# Altium project Digit_input.PrjPcb
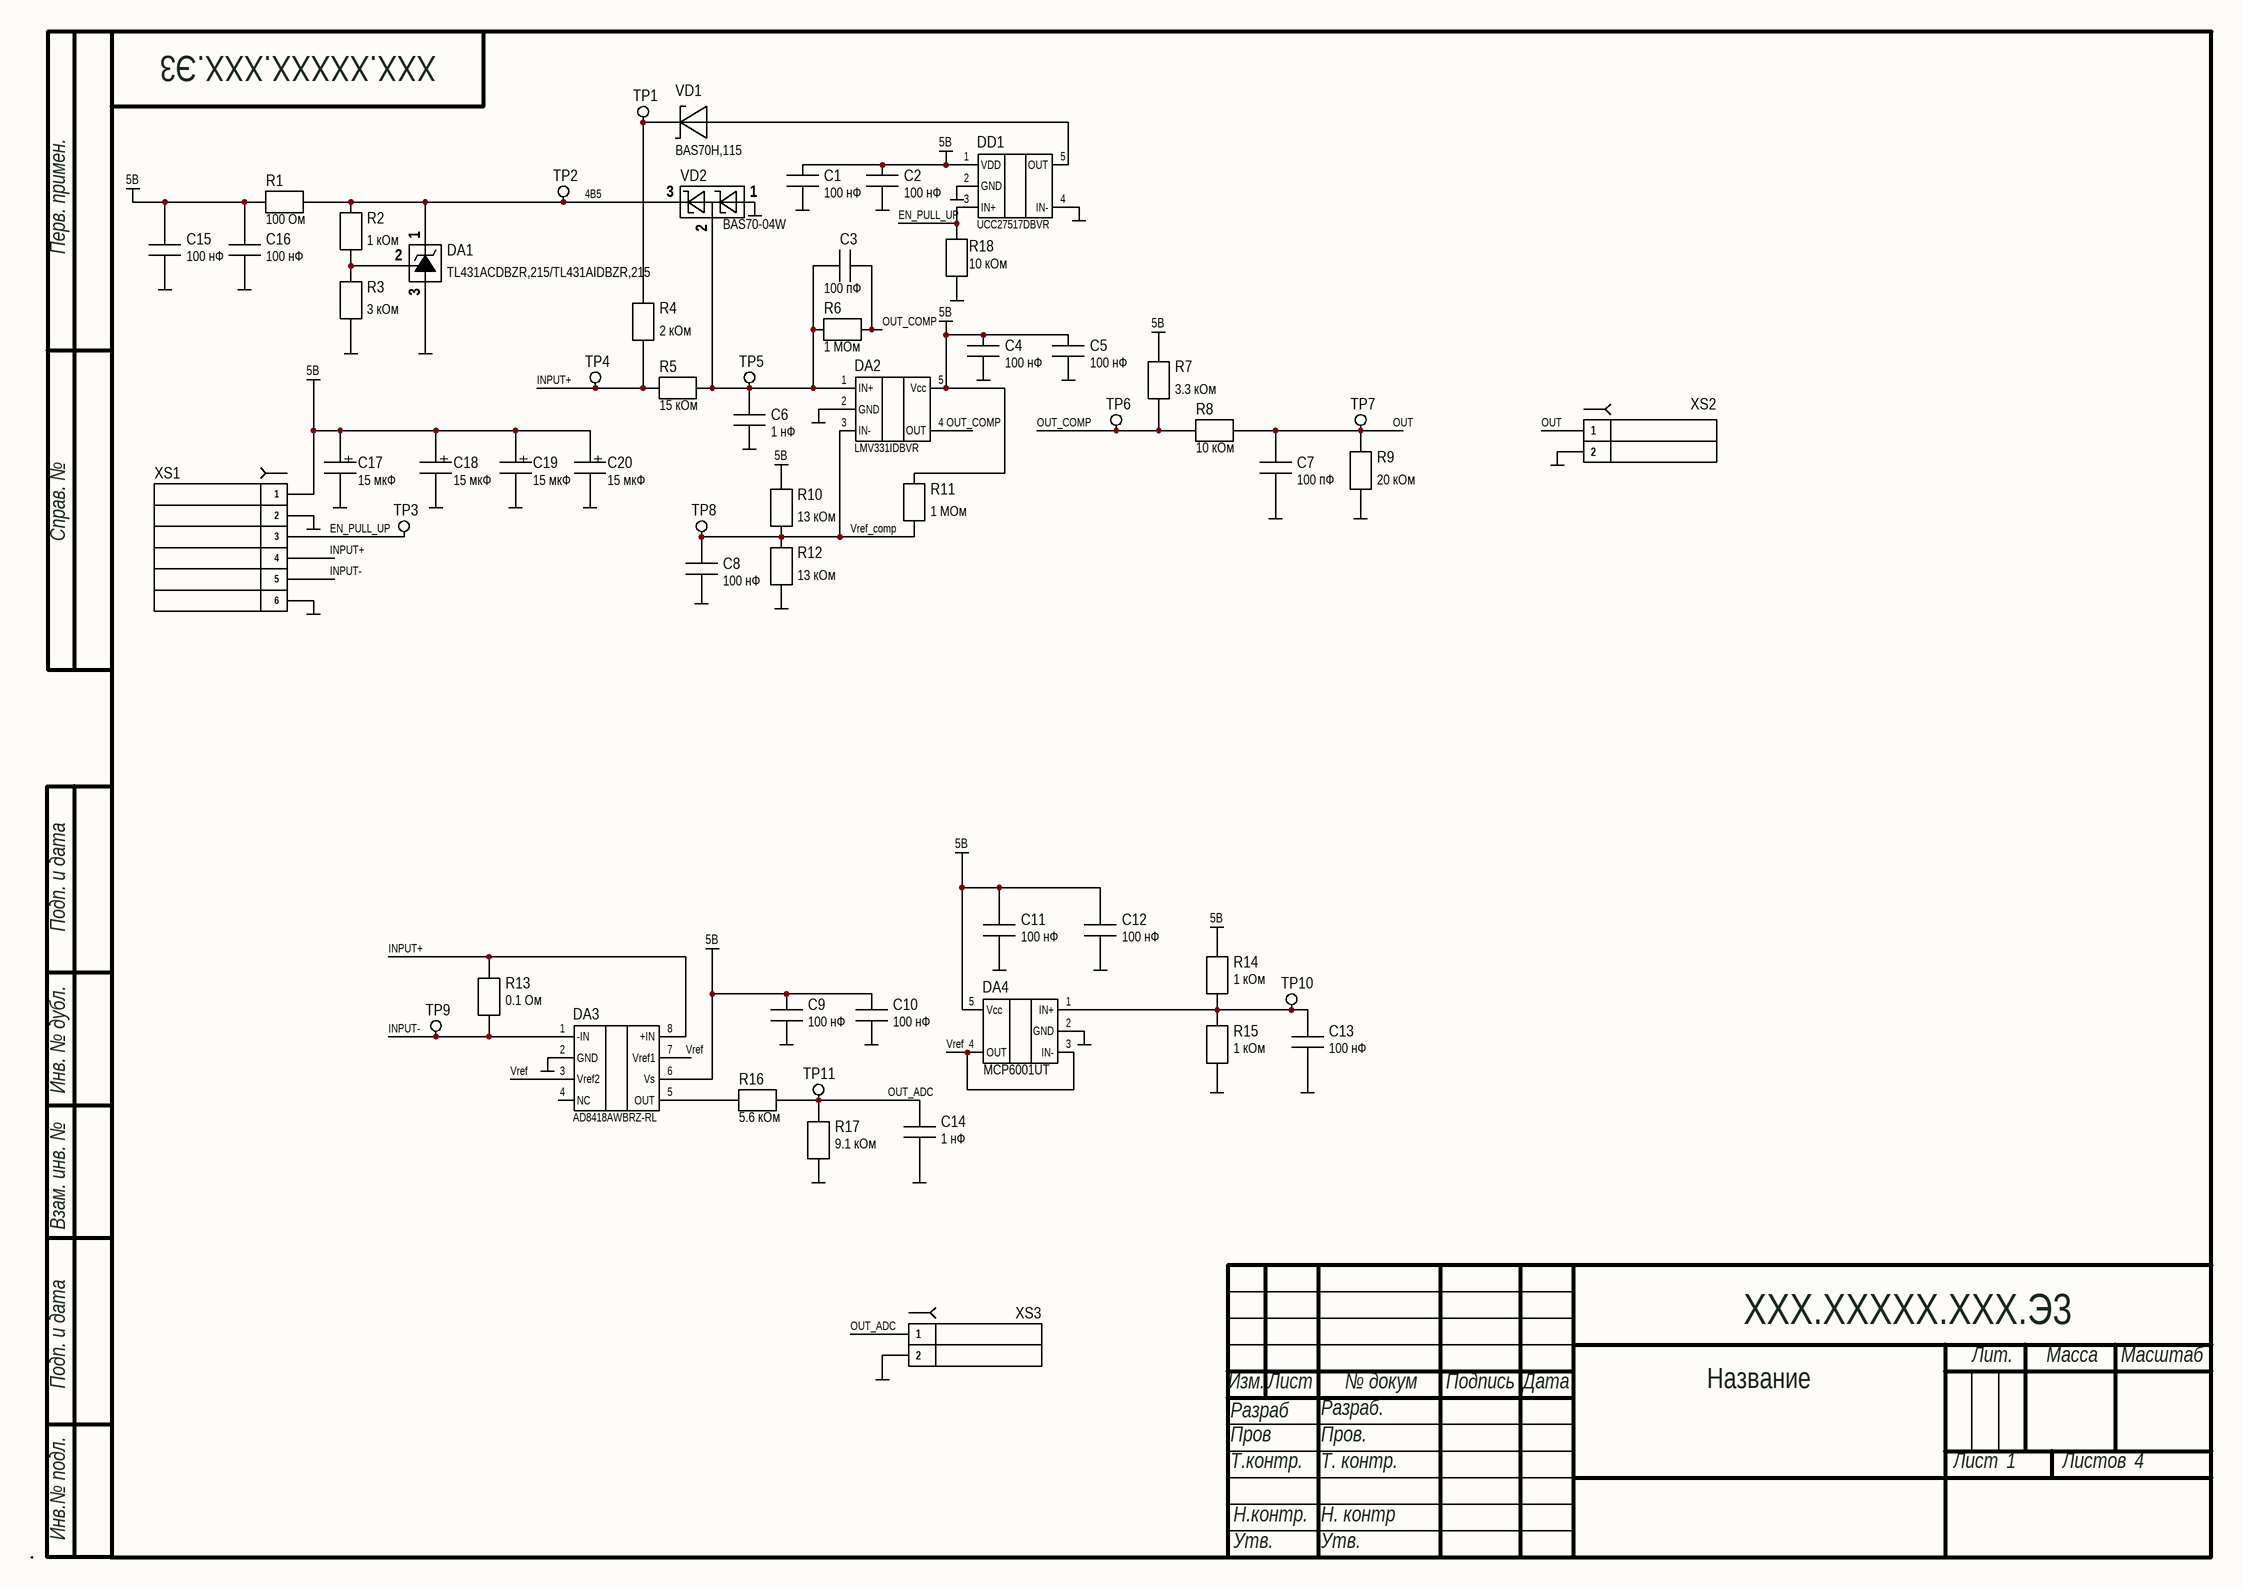
[diagram p0: Digit_input.SchDoc]
4 sheets, 59 parts. Net scope: global (net labels, ports and power ports of the same name join across sheets).
Board file: Digit_input.PcbDoc
Sheets:
  Digit_input.SchDoc
  Шаблон проекта Л2.SchDoc
  Шаблон проекта Л3.SchDoc
  Шаблон проекта Л4.SchDoc

## Sheet Digit_input.SchDoc
size 420 x 297 mm; Разраб.: Разраб.; Пров.: Пров.; Т.контр.: Т. контр.; Н.контр.: Н. контр; Утв.: Утв.; Лист: 1; Листов: 4; Децим.  №: ХXX.XXXXX.XXX.Э3; Название: Название; Лист.: 1; Листов.: 1

### Parts
C1  100 нФ  [CAP 0603 3D]
C2  100 нФ  [CAP 0603 3D]
C3  100 пФ  [CAP 0603 3D]
C4  100 нФ  [CAP 0603 3D]
C5  100 нФ  [CAP 0603 3D]
C6  1 нФ  [CAP 0603 3D]
C7  100 пФ  [CAP 0603 3D]
C8  100 нФ  [CAP 0603 3D]
C9  100 нФ  [CAP 0603 3D]
C10  100 нФ  [CAP 0603 3D]
C11  100 нФ  [CAP 0603 3D]
C12  100 нФ  [CAP 0603 3D]
C13  100 нФ  [CAP 0603 3D]
C14  1 нФ  [CAP 0603 3D]
C15  100 нФ  [CAP 0603 3D]
C16  100 нФ  [CAP 0603 3D]
C17  15 мкФ  [Tant B]
C18  15 мкФ  [Tant B]
C19  15 мкФ  [Tant B]
C20  15 мкФ  [Tant B]
DA1  TL431ACDBZR,215/TL431AIDBZR,215  [SOT-23-3 (132)]
DA2  LMV331IDBVR  [SOT-23-5]
DA3  AD8418AWBRZ-RL  [SOIC-8 150mil]
DA4  MCP6001UT  [SOT-23-5]
DD1  UCC27517DBVR  [SOT-23-5]
R1  100 Ом  [Res_0603 3D]
R2  1 кОм  [Res_0603 3D]
R3  3 кОм  [Res_0603 3D]
R4  2 кОм  [Res_0603 3D]
R5  15 кОм  [Res_0603 3D]
R6  1 МОм  [Res_0603 3D]
R7  3.3 кОм  [Res_0603 3D]
R8  10 кОм  [Res_0603 3D]
R9  20 кОм  [Res_0603 3D]
R10  13 кОм  [Res_0603 3D]
R11  1 МОм  [Res_0603 3D]
R12  13 кОм  [Res_0603 3D]
R13  0.1 Ом  [Res_2512 3D]
R14  1 кОм  [Res_0603 3D]
R15  1 кОм  [Res_0603 3D]
R16  5.6 кОм  [Res_0603 3D]
R17  9.1 кОм  [Res_0603 3D]
R18  10 кОм  [Res_0603 3D]
TP1  TP  [Test_Point_1_5mm]  (value not drawn)
TP2  TP  [Test_Point_1mm]  (value not drawn)
TP3  TP  [Test_Point_1_5mm]  (value not drawn)
TP4  TP  [Test_Point_1_5mm]  (value not drawn)
TP5  TP  [Test_Point_1_5mm]  (value not drawn)
TP6  TP  [Test_Point_1_5mm]  (value not drawn)
TP7  TP  [Test_Point_1_5mm]  (value not drawn)
TP8  TP  [Test_Point_1_5mm]  (value not drawn)
TP9  TP  [Test_Point_1_5mm]  (value not drawn)
TP10  TP  [Test_Point_1_5mm]  (value not drawn)
TP11  TP  [Test_Point_1_5mm]  (value not drawn)
VD1  BAS70H,115  [SOD-123f]
VD2  BAS70-04W  [SOT-323]
XS1  KF-301-6P  [Degson_DG301-5.0-06P-1X]  (value not drawn)
XS2  KF-301-2P  [Degson_DG301-5.0-02P-1X]  (value not drawn)
XS3  KF-301-2P  [Degson_DG301-5.0-02P-1X]  (value not drawn)

### Nets
5В: C1.1 C2.1 C4.1 C5.1 C9.1 C10.1 C11.1 C12.1 C15.1 C16.1 C17.1(+) C18.1(+) C19.1(+) C20.1(+) DA2.5(Vcc) DA3.6(Vs) DA4.5(Vcc) DD1.1(VDD) R1.1 R7.2 R10.2 R11.2 R14.2 XS1.1
GND: C1.2 C2.2 C4.2 C5.2 C6.2 C7.2 C8.2 C9.2 C10.2 C11.2 C12.2 C13.2 C14.2 C15.2 C16.2 C17.2(-) C18.2(-) C19.2(-) C20.2(-) DA1.3(A) DA2.2(GND) DA3.2(GND) DA4.2(GND) DD1.2(GND) DD1.4(IN-) R3.1 R9.1 R12.1 R15.1 R17.1 R18.1 VD2.1(A1) XS1.2 XS1.6 XS2.2 XS3.2
4В5: DA1.1(Cat) R1.2 R2.2 TP2.1 VD2.3(C2)
EN_PULL_UP: DD1.3(IN+) R18.2 TP3.1 XS1.3
INPUT+: DA3.8(+IN) R4.1 R5.1 R13.2 TP4.1 XS1.4
INPUT-: DA3.1(-IN) R13.1 TP9.1 XS1.5
OUT: C7.1 R8.2 R9.2 TP7.1 XS2.1
OUT_ADC: C14.1 R16.2 R17.2 TP11.1 XS3.1
OUT_COMP: C3.1 DA2.4(OUT) R6.2 R7.1 R8.1 TP6.1
Vref: DA3.3(Vref2) DA3.7(Vref1) DA4.3(IN-) DA4.4(OUT)
Vref_comp: C8.1 DA2.3(IN-) R10.1 R11.1 R12.2 TP8.1
NetC3_2: C3.2 C6.1 DA2.1(IN+) R5.2 R6.1 TP5.1 VD2.2(Ca)
NetC13_1: C13.1 DA4.1(IN+) R14.1 R15.2 TP10.1
NetDA1_2: DA1.2(Ref) R2.1 R3.2
NetDA3_5: DA3.5(OUT) R16.1
NetDD1_5: DD1.5(OUT) VD1.2(A)
NetR4_2: R4.2 TP1.1 VD1.1(K)

Not connected (* = marked no-connect by the designer): DA3 4(NC)

### Notes on the sheet
- Перв. примен.
- Справ. №
- Подп. и дата
- Инв. № дубл.
- Взам. инв. №
- Изм.
- Лист
- № докум
- Подпись
- Дата
- Лит.
- Масса
- Масштаб
- Разраб
- Пров
- Т.контр.
- Листов
- Инв.№ подл.
- Н.контр.
- Утв.

### Library data of the parts
C1 C2 C4 C5 C8-C13 C15 C16 = C: GCM188R71H104KA57D
C3 C7 = C: GRM1885C2A101JA01D
C6 C14 = C: GRM1885C1H102J
C17-C20 = C T: 293D106X9016B2TE3
DA1 = TL431 (SOT-23-3)
DA2 DA4 = LMV331
DA3 = AD8418
DD1 = UCC27517
R1 = R: RC0603FR-07100RL
R2 R14 R15 = R: RC0603FR-071KL
R3 = R: RC0603FR-073KL
R4 = R: RC0603FR-072KL
R5 = R: RC0603FR-0715KL
R6 R11 = R: RC0603FR-071ML
R7 = R: RC0603FR-073K3L
R8 R18 = R: RC0603FR-0710KL
R9 = R: RC0603FR-0720KL
R10 R12 = R: RC0603FR-0713KL
R13 = R: RL2512FK-070R1L / RL2512FK-070R2L
R16 = R: RC0603FR-075K6L
R17 = R: RC0603FR-079K1L
VD1 = Диод Шот. х1
VD2 = Диод Шот  А1&К2 (2)

## Sheet Шаблон проекта Л2.SchDoc
size 420 x 297 mm; Разраб.: Разраб.; Лист: 2; Листов: 4; Децим.  №: XXX.XXXXX.XXX.Э3

### Notes on the sheet
- Перв. примен.
- Справ. №
- Подп. и дата
- Инв. № дубл.
- Взам. инв. №
- Инв.№ подл.
- Лист
- Изм.
- № докум
- Подпись
- Дата

## Sheet Шаблон проекта Л3.SchDoc
size 420 x 297 mm; Разраб.: Разраб.; Лист: 3; Листов: 4; Децим.  №: XXX.XXXXX.XXX.Э3

### Notes on the sheet
- Перв. примен.
- Справ. №
- Подп. и дата
- Инв. № дубл.
- Взам. инв. №
- Инв.№ подл.
- Лист
- Изм.
- № докум
- Подпись
- Дата

## Sheet Шаблон проекта Л4.SchDoc
size 420 x 297 mm; Разраб.: Бурыкин; Лист: 4; Листов: 4; Децим.  №: XXX.XXXXX.XXX.Э3

### Notes on the sheet
- Перв. примен.
- Справ. №
- Подп. и дата
- Инв. № дубл.
- Взам. инв. №
- Инв.№ подл.
- Лист
- Изм.
- № докум
- Подпись
- Дата